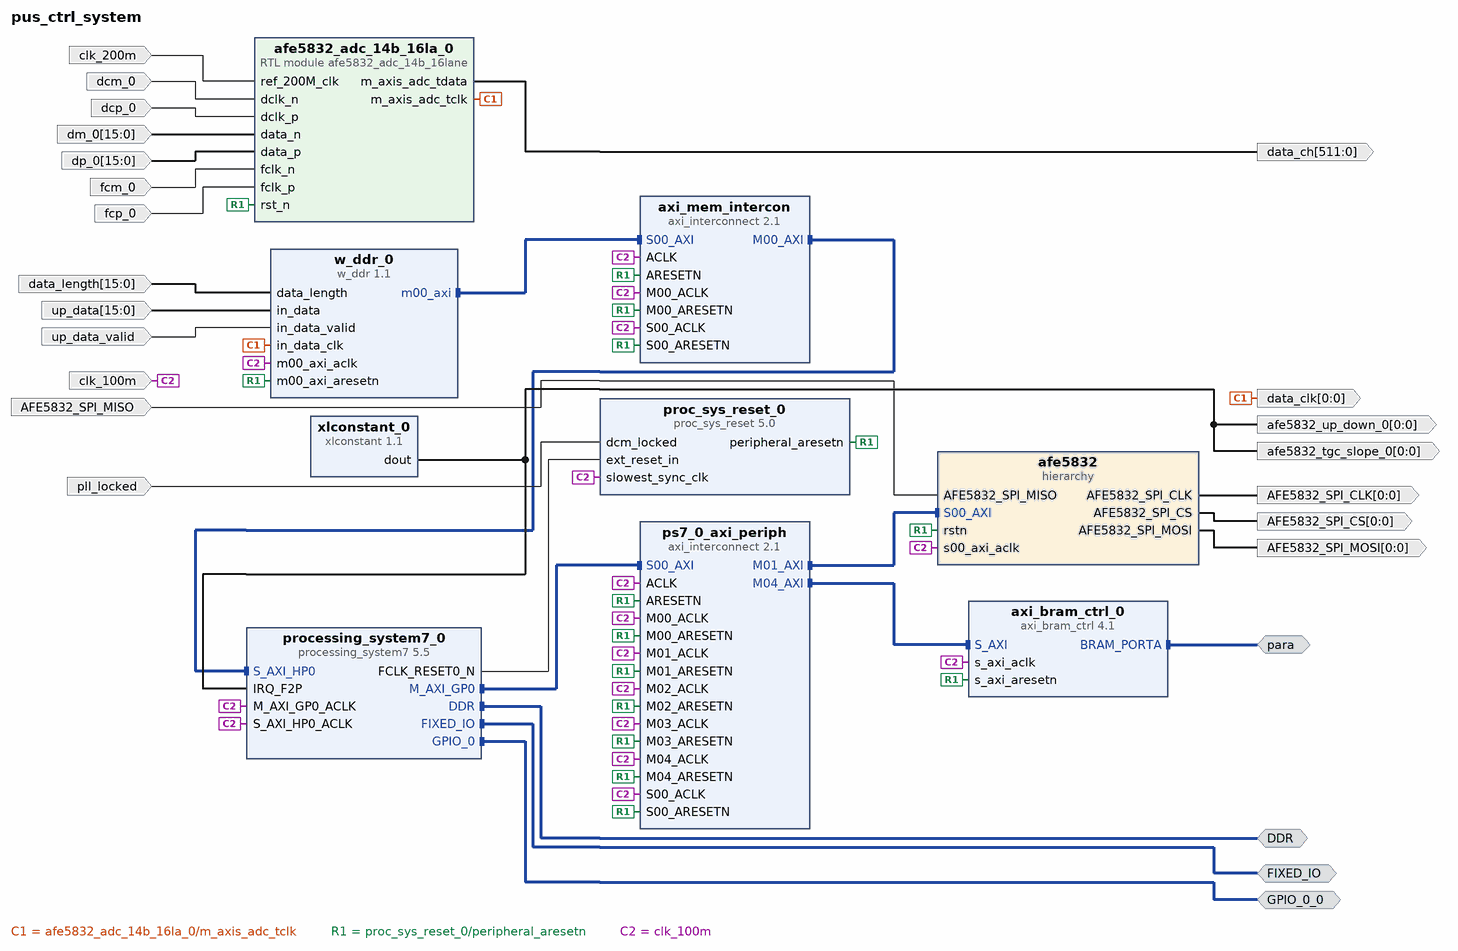
[diagram p0: block diagram of the top level]
# Vivado block design pus_ctrl_system, xc7z030sbg485-2, Vivado 2026.1
create_bd_design pus_ctrl_system

create_bd_intf_port -mode Master -vlnv xilinx.com:interface:ddrx_rtl:1.0 DDR
create_bd_intf_port -mode Master -vlnv xilinx.com:display_processing_system7:fixedio_rtl:1.0 FIXED_IO
create_bd_intf_port -mode Master -vlnv xilinx.com:interface:gpio_rtl:1.0 GPIO_0_0
create_bd_intf_port -mode Master -vlnv xilinx.com:interface:bram_rtl:1.0 para
set_property -dict {CONFIG.MASTER_TYPE BRAM_CTRL CONFIG.READ_WRITE_MODE READ_WRITE} [get_bd_intf_ports para]
create_bd_port -dir I -type clk clk_100m
create_bd_port -dir O -from 0 -to 0 AFE5832_SPI_CS
create_bd_port -dir O -from 0 -to 0 -type clk AFE5832_SPI_CLK
create_bd_port -dir O -from 0 -to 0 AFE5832_SPI_MOSI
create_bd_port -dir I AFE5832_SPI_MISO
create_bd_port -dir I -type clk dcp_0
set_property -dict {CONFIG.FREQ_HZ 400000000} [get_bd_ports dcp_0]
create_bd_port -dir I -type clk dcm_0
set_property -dict {CONFIG.FREQ_HZ 400000000} [get_bd_ports dcm_0]
create_bd_port -dir I fcp_0
create_bd_port -dir I fcm_0
create_bd_port -dir I -from 15 -to 0 dp_0
create_bd_port -dir I -from 15 -to 0 dm_0
create_bd_port -dir O -from 0 -to 0 afe5832_tgc_slope_0
create_bd_port -dir O -from 0 -to 0 afe5832_up_down_0
create_bd_port -dir O -from 511 -to 0 data_ch
create_bd_port -dir O -from 0 -to 0 -type clk data_clk
create_bd_port -dir I pll_locked
create_bd_port -dir I up_data_valid
create_bd_port -dir I -from 15 -to 0 up_data
create_bd_port -dir I -from 15 -to 0 data_length
create_bd_port -dir I clk_200m

create_bd_cell -type ip -vlnv xilinx.com:ip:axi_interconnect:2.1 axi_mem_intercon
set_property -dict {CONFIG.NUM_MI 1} [get_bd_cells axi_mem_intercon]
create_bd_cell -type ip -vlnv xilinx.com:ip:axi_interconnect:2.1 ps7_0_axi_periph
set_property -dict {CONFIG.NUM_MI 5} [get_bd_cells ps7_0_axi_periph]
create_bd_cell -type hier afe5832
create_bd_cell -type ip -vlnv xilinx.com:ip:proc_sys_reset:5.0 proc_sys_reset_0
create_bd_cell -type ip -vlnv xilinx.com:ip:axi_bram_ctrl:4.1 axi_bram_ctrl_0
set_property -dict {CONFIG.SINGLE_PORT_BRAM 1} [get_bd_cells axi_bram_ctrl_0]
create_bd_cell -type ip -vlnv xilinx.com:ip:xlconstant:1.1 xlconstant_0
set_property -dict {CONFIG.CONST_VAL 0} [get_bd_cells xlconstant_0]
create_bd_cell -type module -reference afe5832_adc_14b_16lane afe5832_adc_14b_16la_0
create_bd_cell -type ip -vlnv xilinx.com:ip:processing_system7:5.5 processing_system7_0
set_property -dict [list \
  CONFIG.PCW_APU_PERIPHERAL_FREQMHZ 666.666666 \
  CONFIG.PCW_CPU_CPU_6X4X_MAX_RANGE 800 \
  CONFIG.PCW_ENET0_PERIPHERAL_ENABLE 0 \
  CONFIG.PCW_FCLK_CLK0_BUF FALSE \
  CONFIG.PCW_FPGA0_PERIPHERAL_FREQMHZ 100 \
  CONFIG.PCW_FPGA1_PERIPHERAL_FREQMHZ 50 \
  CONFIG.PCW_GPIO_EMIO_GPIO_ENABLE 1 \
  CONFIG.PCW_GPIO_EMIO_GPIO_IO 19 \
  CONFIG.PCW_GPIO_EMIO_GPIO_WIDTH 19 \
  CONFIG.PCW_GPIO_MIO_GPIO_ENABLE 1 \
  CONFIG.PCW_GPIO_MIO_GPIO_IO MIO \
  CONFIG.PCW_I2C0_GRP_INT_ENABLE 0 \
  CONFIG.PCW_I2C0_I2C0_IO {MIO 18 .. 19} \
  CONFIG.PCW_I2C0_PERIPHERAL_ENABLE 1 \
  CONFIG.PCW_I2C1_I2C1_IO {MIO 20 .. 21} \
  CONFIG.PCW_I2C1_PERIPHERAL_ENABLE 1 \
  CONFIG.PCW_I2C_PERIPHERAL_FREQMHZ 111.111115 \
  CONFIG.PCW_I2C_RESET_ENABLE 1 \
  CONFIG.PCW_I2C_RESET_SELECT {Share reset pin} \
  CONFIG.PCW_IRQ_F2P_INTR 1 \
  CONFIG.PCW_PERIPHERAL_BOARD_PRESET None \
  CONFIG.PCW_PRESET_BANK1_VOLTAGE {LVCMOS 3.3V} \
  CONFIG.PCW_QSPI_GRP_FBCLK_ENABLE 1 \
  CONFIG.PCW_QSPI_GRP_FBCLK_IO {MIO 8} \
  CONFIG.PCW_QSPI_GRP_SINGLE_SS_ENABLE 1 \
  CONFIG.PCW_QSPI_GRP_SINGLE_SS_IO {MIO 1 .. 6} \
  CONFIG.PCW_QSPI_PERIPHERAL_ENABLE 1 \
  CONFIG.PCW_QSPI_QSPI_IO {MIO 1 .. 6} \
  CONFIG.PCW_SD0_PERIPHERAL_ENABLE 0 \
  CONFIG.PCW_SD1_PERIPHERAL_ENABLE 1 \
  CONFIG.PCW_SD1_SD1_IO {MIO 10 .. 15} \
  CONFIG.PCW_SDIO_PERIPHERAL_FREQMHZ 100 \
  CONFIG.PCW_SINGLE_QSPI_DATA_MODE x4 \
  CONFIG.PCW_SPI1_PERIPHERAL_ENABLE 1 \
  CONFIG.PCW_SPI1_SPI1_IO {MIO 22 .. 27} \
  CONFIG.PCW_TTC0_PERIPHERAL_ENABLE 1 \
  CONFIG.PCW_TTC0_TTC0_IO EMIO \
  CONFIG.PCW_UART1_PERIPHERAL_ENABLE 1 \
  CONFIG.PCW_UART1_UART1_IO {MIO 16 .. 17} \
  CONFIG.PCW_UART_PERIPHERAL_FREQMHZ 100 \
  CONFIG.PCW_UIPARAM_DDR_FREQ_MHZ 533.333333 \
  CONFIG.PCW_UIPARAM_DDR_PARTNO {MT41J256M16 RE-125} \
  CONFIG.PCW_USB0_PERIPHERAL_ENABLE 1 \
  CONFIG.PCW_USB0_RESET_ENABLE 0 \
  CONFIG.PCW_USB0_USB0_IO {MIO 28 .. 39} \
  CONFIG.PCW_USB1_PERIPHERAL_ENABLE 1 \
  CONFIG.PCW_USB1_RESET_ENABLE 1 \
  CONFIG.PCW_USB1_RESET_IO {MIO 53} \
  CONFIG.PCW_USB1_USB1_IO {MIO 40 .. 51} \
  CONFIG.PCW_USB_RESET_ENABLE 1 \
  CONFIG.PCW_USB_RESET_SELECT {Separate reset pins} \
  CONFIG.PCW_USE_FABRIC_INTERRUPT 1 \
  CONFIG.PCW_USE_S_AXI_HP0 1 \
  CONFIG.preset None \
] [get_bd_cells processing_system7_0]
# 519 more settings of processing_system7_0 are not shown: defaults, MIO pin electricals, DDR timing, and values the tool derives
create_bd_cell -type ip -vlnv xilinx.com:user:w_ddr:1.1 w_ddr_0
set_property -dict [list \
  CONFIG.BURST_BUFFER_NUMS 500 \
  CONFIG.C_M00_AXI_DATA_WIDTH 64 \
  CONFIG.C_M_TARGET_SLAVE_PER_LINE_INC_ADDR 0x00020000 \
  CONFIG.FIFO_RD_WIDTH 64 \
] [get_bd_cells w_ddr_0]

# ---- hierarchy /afe5832 ----
current_bd_instance /afe5832
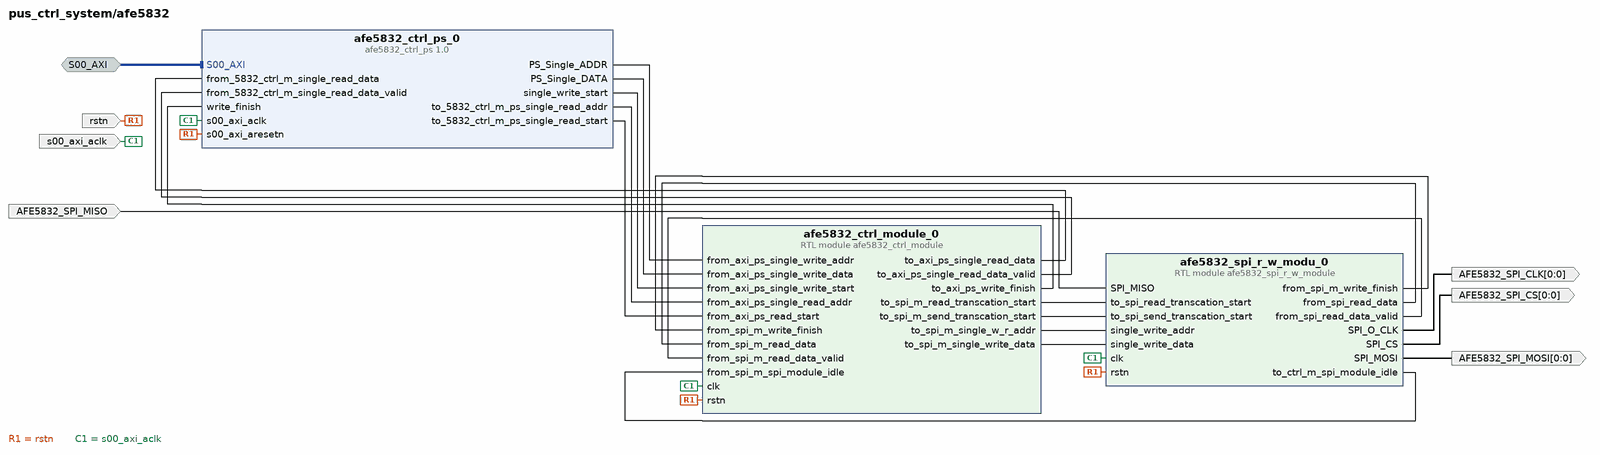
[diagram p1: block diagram inside /afe5832]
create_bd_intf_pin -mode Slave -vlnv xilinx.com:interface:aximm_rtl:1.0 S00_AXI
create_bd_pin -dir I AFE5832_SPI_MISO
create_bd_pin -dir O -from 0 -to 0 AFE5832_SPI_CS
create_bd_pin -dir O -from 0 -to 0 -type clk AFE5832_SPI_CLK
create_bd_pin -dir O -from 0 -to 0 AFE5832_SPI_MOSI
create_bd_pin -dir I -type clk s00_axi_aclk
create_bd_pin -dir I -type rst rstn

create_bd_cell -type module -reference afe5832_ctrl_module afe5832_ctrl_module_0
create_bd_cell -type module -reference afe5832_spi_r_w_module afe5832_spi_r_w_modu_0
create_bd_cell -type ip -vlnv xilinx.com:user:afe5832_ctrl_ps:1.0 afe5832_ctrl_ps_0

# ---- connections ----

current_bd_instance /afe5832
connect_bd_intf_net [get_bd_intf_pins S00_AXI] [get_bd_intf_pins afe5832_ctrl_ps_0/S00_AXI]
connect_bd_net [get_bd_pins AFE5832_SPI_MISO] [get_bd_pins afe5832_spi_r_w_modu_0/SPI_MISO]
connect_bd_net [get_bd_pins afe5832_ctrl_module_0/to_axi_ps_single_read_data] [get_bd_pins afe5832_ctrl_ps_0/from_5832_ctrl_m_single_read_data]
connect_bd_net [get_bd_pins afe5832_ctrl_module_0/to_axi_ps_single_read_data_valid] \
  [get_bd_pins afe5832_ctrl_ps_0/from_5832_ctrl_m_single_read_data_valid]
connect_bd_net [get_bd_pins afe5832_ctrl_module_0/to_axi_ps_write_finish] [get_bd_pins afe5832_ctrl_ps_0/write_finish]
connect_bd_net [get_bd_pins afe5832_ctrl_module_0/to_spi_m_read_transcation_start] [get_bd_pins afe5832_spi_r_w_modu_0/to_spi_read_transcation_start]
connect_bd_net [get_bd_pins afe5832_ctrl_module_0/to_spi_m_send_transcation_start] [get_bd_pins afe5832_spi_r_w_modu_0/to_spi_send_transcation_start]
connect_bd_net [get_bd_pins afe5832_ctrl_module_0/to_spi_m_single_w_r_addr] [get_bd_pins afe5832_spi_r_w_modu_0/single_write_addr]
connect_bd_net [get_bd_pins afe5832_ctrl_module_0/to_spi_m_single_write_data] [get_bd_pins afe5832_spi_r_w_modu_0/single_write_data]
connect_bd_net [get_bd_pins afe5832_ctrl_ps_0/PS_Single_ADDR] [get_bd_pins afe5832_ctrl_module_0/from_axi_ps_single_write_addr]
connect_bd_net [get_bd_pins afe5832_ctrl_ps_0/PS_Single_DATA] [get_bd_pins afe5832_ctrl_module_0/from_axi_ps_single_write_data]
connect_bd_net [get_bd_pins afe5832_ctrl_ps_0/single_write_start] [get_bd_pins afe5832_ctrl_module_0/from_axi_ps_single_write_start]
connect_bd_net [get_bd_pins afe5832_ctrl_ps_0/to_5832_ctrl_m_ps_single_read_addr] [get_bd_pins afe5832_ctrl_module_0/from_axi_ps_single_read_addr]
connect_bd_net [get_bd_pins afe5832_ctrl_ps_0/to_5832_ctrl_m_ps_single_read_start] [get_bd_pins afe5832_ctrl_module_0/from_axi_ps_read_start]
connect_bd_net [get_bd_pins afe5832_spi_r_w_modu_0/SPI_CS] [get_bd_pins AFE5832_SPI_CS]
connect_bd_net [get_bd_pins afe5832_spi_r_w_modu_0/SPI_MOSI] [get_bd_pins AFE5832_SPI_MOSI]
connect_bd_net [get_bd_pins afe5832_spi_r_w_modu_0/SPI_O_CLK] [get_bd_pins AFE5832_SPI_CLK]
connect_bd_net [get_bd_pins afe5832_spi_r_w_modu_0/from_spi_m_write_finish] [get_bd_pins afe5832_ctrl_module_0/from_spi_m_write_finish]
connect_bd_net [get_bd_pins afe5832_spi_r_w_modu_0/from_spi_read_data] [get_bd_pins afe5832_ctrl_module_0/from_spi_m_read_data]
connect_bd_net [get_bd_pins afe5832_spi_r_w_modu_0/from_spi_read_data_valid] [get_bd_pins afe5832_ctrl_module_0/from_spi_m_read_data_valid]
connect_bd_net [get_bd_pins afe5832_spi_r_w_modu_0/to_ctrl_m_spi_module_idle] [get_bd_pins afe5832_ctrl_module_0/from_spi_m_spi_module_idle]
connect_bd_net [get_bd_pins rstn] \
  [get_bd_pins afe5832_ctrl_module_0/rstn] [get_bd_pins afe5832_spi_r_w_modu_0/rstn] \
  [get_bd_pins afe5832_ctrl_ps_0/s00_axi_aresetn]
connect_bd_net [get_bd_pins s00_axi_aclk] \
  [get_bd_pins afe5832_ctrl_module_0/clk] [get_bd_pins afe5832_spi_r_w_modu_0/clk] \
  [get_bd_pins afe5832_ctrl_ps_0/s00_axi_aclk]

current_bd_instance /
connect_bd_intf_net [get_bd_intf_ports para] [get_bd_intf_pins axi_bram_ctrl_0/BRAM_PORTA]
connect_bd_intf_net [get_bd_intf_pins axi_mem_intercon/M00_AXI] [get_bd_intf_pins processing_system7_0/S_AXI_HP0]
connect_bd_intf_net [get_bd_intf_ports DDR] [get_bd_intf_pins processing_system7_0/DDR]
connect_bd_intf_net [get_bd_intf_ports FIXED_IO] [get_bd_intf_pins processing_system7_0/FIXED_IO]
connect_bd_intf_net [get_bd_intf_ports GPIO_0_0] [get_bd_intf_pins processing_system7_0/GPIO_0]
connect_bd_intf_net [get_bd_intf_pins processing_system7_0/M_AXI_GP0] [get_bd_intf_pins ps7_0_axi_periph/S00_AXI]
connect_bd_intf_net [get_bd_intf_pins ps7_0_axi_periph/M01_AXI] [get_bd_intf_pins afe5832/S00_AXI]
connect_bd_intf_net [get_bd_intf_pins ps7_0_axi_periph/M04_AXI] [get_bd_intf_pins axi_bram_ctrl_0/S_AXI]
connect_bd_intf_net [get_bd_intf_pins w_ddr_0/m00_axi] [get_bd_intf_pins axi_mem_intercon/S00_AXI]
connect_bd_net -net AFE5832_SPI_MISO_0_1 [get_bd_ports AFE5832_SPI_MISO] [get_bd_pins afe5832/AFE5832_SPI_MISO]
connect_bd_net [get_bd_pins afe5832/AFE5832_SPI_CLK] [get_bd_ports AFE5832_SPI_CLK]
connect_bd_net [get_bd_pins afe5832/AFE5832_SPI_CS] [get_bd_ports AFE5832_SPI_CS]
connect_bd_net [get_bd_pins afe5832/AFE5832_SPI_MOSI] [get_bd_ports AFE5832_SPI_MOSI]
connect_bd_net [get_bd_pins afe5832_adc_14b_16la_0/m_axis_adc_tdata] [get_bd_ports data_ch]
connect_bd_net [get_bd_ports clk_200m] [get_bd_pins afe5832_adc_14b_16la_0/ref_200M_clk]
connect_bd_net -net data_length_0_1 [get_bd_ports data_length] [get_bd_pins w_ddr_0/data_length]
connect_bd_net -net data_sample_data_clk_0 [get_bd_pins afe5832_adc_14b_16la_0/m_axis_adc_tclk] \
  [get_bd_ports data_clk] [get_bd_pins w_ddr_0/in_data_clk]
connect_bd_net -net dcm_0_1 [get_bd_ports dcm_0] [get_bd_pins afe5832_adc_14b_16la_0/dclk_n]
connect_bd_net -net dcm_locked_0_1 [get_bd_ports pll_locked] [get_bd_pins proc_sys_reset_0/dcm_locked]
connect_bd_net -net dcp_0_1 [get_bd_ports dcp_0] [get_bd_pins afe5832_adc_14b_16la_0/dclk_p]
connect_bd_net -net dm_0_1 [get_bd_ports dm_0] [get_bd_pins afe5832_adc_14b_16la_0/data_n]
connect_bd_net -net dp_0_1 [get_bd_ports dp_0] [get_bd_pins afe5832_adc_14b_16la_0/data_p]
connect_bd_net -net fcm_0_1 [get_bd_ports fcm_0] [get_bd_pins afe5832_adc_14b_16la_0/fclk_n]
connect_bd_net -net fcp_0_1 [get_bd_ports fcp_0] [get_bd_pins afe5832_adc_14b_16la_0/fclk_p]
connect_bd_net -net in_data_0_1 [get_bd_ports up_data] [get_bd_pins w_ddr_0/in_data]
connect_bd_net -net in_data_valid_0_1 [get_bd_ports up_data_valid] [get_bd_pins w_ddr_0/in_data_valid]
connect_bd_net [get_bd_pins processing_system7_0/FCLK_RESET0_N] [get_bd_pins proc_sys_reset_0/ext_reset_in]
connect_bd_net -net resetn [get_bd_pins proc_sys_reset_0/peripheral_aresetn] \
  [get_bd_pins axi_mem_intercon/ARESETN] [get_bd_pins axi_mem_intercon/S00_ARESETN] \
  [get_bd_pins axi_mem_intercon/M00_ARESETN] [get_bd_pins ps7_0_axi_periph/ARESETN] \
  [get_bd_pins ps7_0_axi_periph/S00_ARESETN] [get_bd_pins ps7_0_axi_periph/M00_ARESETN] [get_bd_pins afe5832/rstn] \
  [get_bd_pins ps7_0_axi_periph/M01_ARESETN] [get_bd_pins ps7_0_axi_periph/M02_ARESETN] \
  [get_bd_pins ps7_0_axi_periph/M03_ARESETN] [get_bd_pins axi_bram_ctrl_0/s_axi_aresetn] \
  [get_bd_pins ps7_0_axi_periph/M04_ARESETN] [get_bd_pins afe5832_adc_14b_16la_0/rst_n] [get_bd_pins w_ddr_0/m00_axi_aresetn]
connect_bd_net -net sys_clk_g_0_sys_clk [get_bd_ports clk_100m] \
  [get_bd_pins afe5832/s00_axi_aclk] [get_bd_pins axi_mem_intercon/ACLK] [get_bd_pins axi_mem_intercon/S00_ACLK] \
  [get_bd_pins axi_mem_intercon/M00_ACLK] [get_bd_pins ps7_0_axi_periph/ACLK] [get_bd_pins ps7_0_axi_periph/M00_ACLK] \
  [get_bd_pins ps7_0_axi_periph/S00_ACLK] [get_bd_pins ps7_0_axi_periph/M01_ACLK] [get_bd_pins ps7_0_axi_periph/M02_ACLK] \
  [get_bd_pins ps7_0_axi_periph/M03_ACLK] [get_bd_pins proc_sys_reset_0/slowest_sync_clk] \
  [get_bd_pins axi_bram_ctrl_0/s_axi_aclk] [get_bd_pins ps7_0_axi_periph/M04_ACLK] \
  [get_bd_pins processing_system7_0/M_AXI_GP0_ACLK] [get_bd_pins processing_system7_0/S_AXI_HP0_ACLK] \
  [get_bd_pins w_ddr_0/m00_axi_aclk]
connect_bd_net [get_bd_pins xlconstant_0/dout] \
  [get_bd_ports afe5832_tgc_slope_0] [get_bd_ports afe5832_up_down_0] [get_bd_pins processing_system7_0/IRQ_F2P]
set_property HDL_ATTRIBUTE.KEEP_HIERARCHY yes [get_bd_cells axi_bram_ctrl_0]
set_property HDL_ATTRIBUTE.KEEP_HIERARCHY yes [get_bd_cells processing_system7_0]

# ---- address map ----
assign_bd_address -offset 0x40000000 -range 16M -target_address_space [get_bd_addr_spaces processing_system7_0/Data] [get_bd_addr_segs axi_bram_ctrl_0/S_AXI/Mem0]
assign_bd_address -offset 0x43C00000 -range 64K -target_address_space [get_bd_addr_spaces processing_system7_0/Data] [get_bd_addr_segs afe5832/afe5832_ctrl_ps_0/S00_AXI/S00_AXI_reg]
assign_bd_address -offset 0x00000000 -range 1G -target_address_space [get_bd_addr_spaces w_ddr_0/m00_axi] [get_bd_addr_segs processing_system7_0/S_AXI_HP0/HP0_DDR_LOWOCM]

validate_bd_design
save_bd_design
